# Altium schematic sheet Top_Section.SchDoc
size A; DocumentNumber: 6; SheetNumber: 1; SheetTotal: 6
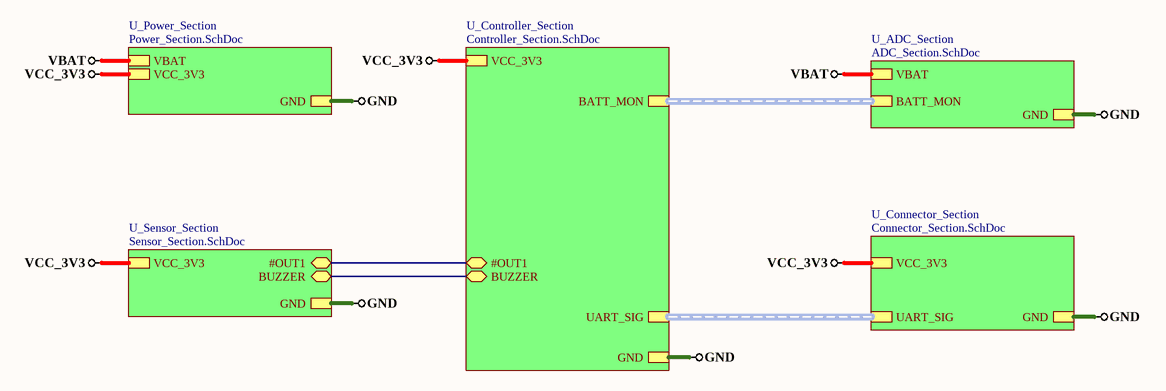
[diagram p0: Top_Section.SchDoc]

## Sub-sheets
U_ADC_Section = ADC_Section.SchDoc: GND, VBAT, BATT_MON (harness BATT_MON)
U_Connector_Section = Connector_Section.SchDoc: GND, UART_SIG (harness UART_SIG), VCC_3V3
U_Controller_Section = Controller_Section.SchDoc: GND, VCC_3V3, #OUT1 (bidir), BATT_MON (harness BATT_MON), UART_SIG (harness UART_SIG), BUZZER (bidir)
U_Power_Section = Power_Section.SchDoc: GND, VBAT, VCC_3V3
U_Sensor_Section = Sensor_Section.SchDoc: GND, VCC_3V3, #OUT1 (bidir), BUZZER (bidir)

## Nets
GND: sheet U_Sensor_Section/GND, sheet U_ADC_Section/GND, sheet U_Power_Section/GND, sheet U_Controller_Section/GND, sheet U_Connector_Section/GND
VBAT: sheet U_ADC_Section/VBAT, sheet U_Power_Section/VBAT
VCC_3V3: sheet U_Sensor_Section/VCC_3V3, sheet U_Power_Section/VCC_3V3, sheet U_Controller_Section/VCC_3V3, sheet U_Connector_Section/VCC_3V3
(unnamed): sheet U_Sensor_Section/#OUT1, sheet U_Controller_Section/#OUT1
(unnamed): sheet U_Sensor_Section/BUZZER, sheet U_Controller_Section/BUZZER

## Buses and harness runs
harness sheet U_ADC_Section/BATT_MON = sheet U_Controller_Section/BATT_MON
harness sheet U_Connector_Section/UART_SIG = sheet U_Controller_Section/UART_SIG